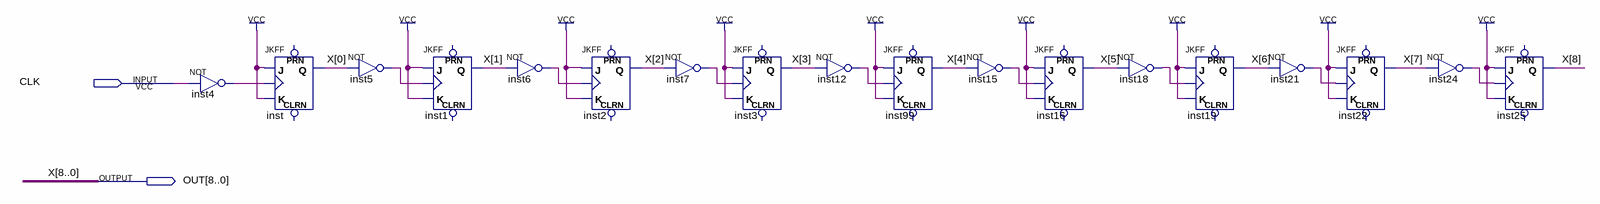
[diagram p0: schematic sheet]
// Quartus schematic Contador_8bits.bdf as structural Verilog: 18 symbols, 2 pins
module Contador_8bits (
  input  CLK,
  output [8:0] OUT
);

  wire inst4_out, inst5_out, inst6_out, inst7_out, inst12_out, inst15_out, inst18_out, inst21_out, inst24_out;

  not inst4 (inst4_out, CLK);
  JKFF inst (.K(1'b1), .J(1'b1), .CLK(inst4_out), .Q(OUT[0]));  // open: PRN, CLRN
  not inst5 (inst5_out, OUT[0]);
  JKFF inst1 (.K(1'b1), .J(1'b1), .CLK(inst5_out), .Q(OUT[1]));  // open: PRN, CLRN
  not inst6 (inst6_out, OUT[1]);
  JKFF inst2 (.K(1'b1), .J(1'b1), .CLK(inst6_out), .Q(OUT[2]));  // open: PRN, CLRN
  not inst7 (inst7_out, OUT[2]);
  JKFF inst3 (.K(1'b1), .J(1'b1), .CLK(inst7_out), .Q(OUT[3]));  // open: PRN, CLRN
  not inst12 (inst12_out, OUT[3]);
  JKFF inst99 (.K(1'b1), .J(1'b1), .CLK(inst12_out), .Q(OUT[4]));  // open: PRN, CLRN
  not inst15 (inst15_out, OUT[4]);
  JKFF inst16 (.K(1'b1), .J(1'b1), .CLK(inst15_out), .Q(OUT[5]));  // open: PRN, CLRN
  not inst18 (inst18_out, OUT[5]);
  JKFF inst19 (.K(1'b1), .J(1'b1), .CLK(inst18_out), .Q(OUT[6]));  // open: PRN, CLRN
  not inst21 (inst21_out, OUT[6]);
  JKFF inst22 (.K(1'b1), .J(1'b1), .CLK(inst21_out), .Q(OUT[7]));  // open: PRN, CLRN
  not inst24 (inst24_out, OUT[7]);
  JKFF inst25 (.K(1'b1), .J(1'b1), .CLK(inst24_out), .Q(OUT[8]));  // open: PRN, CLRN

  // Other names for the same wires on the sheet: X[8:0] = OUT
endmodule
